# Altium schematic sheet PCB-PWR_01_INPUT_PROTECTION.SchDoc
size 420 x 297 mm
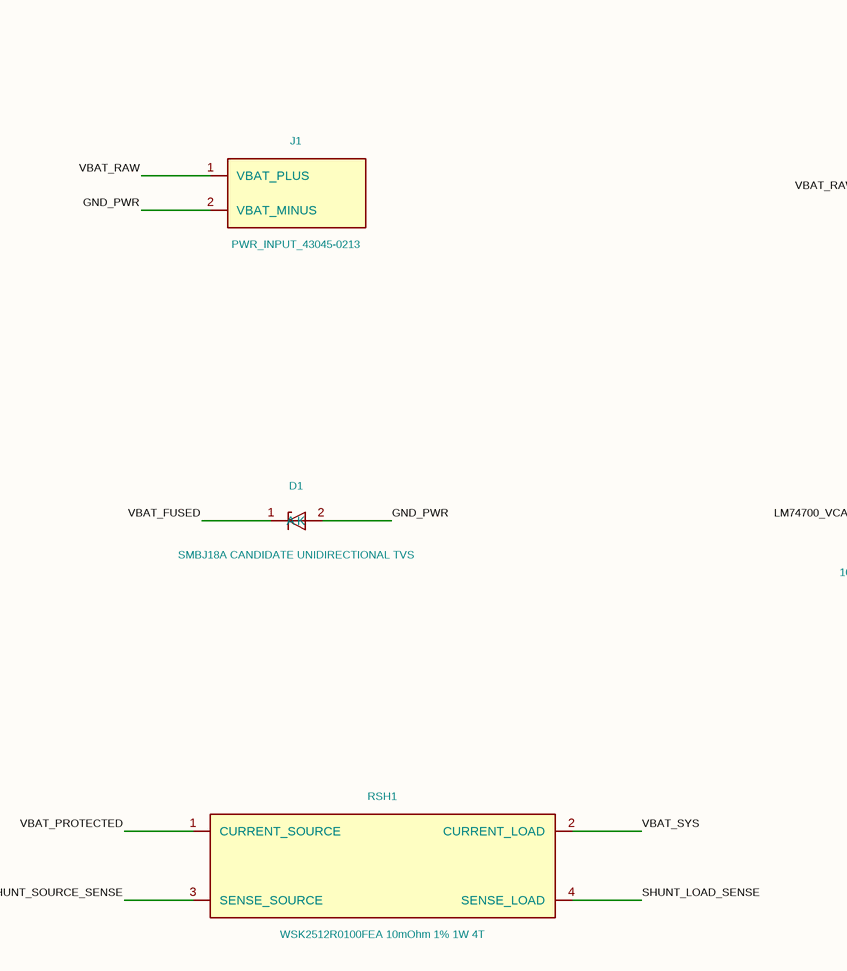
[diagram p0: PCB-PWR_01_INPUT_PROTECTION.SchDoc, top left]
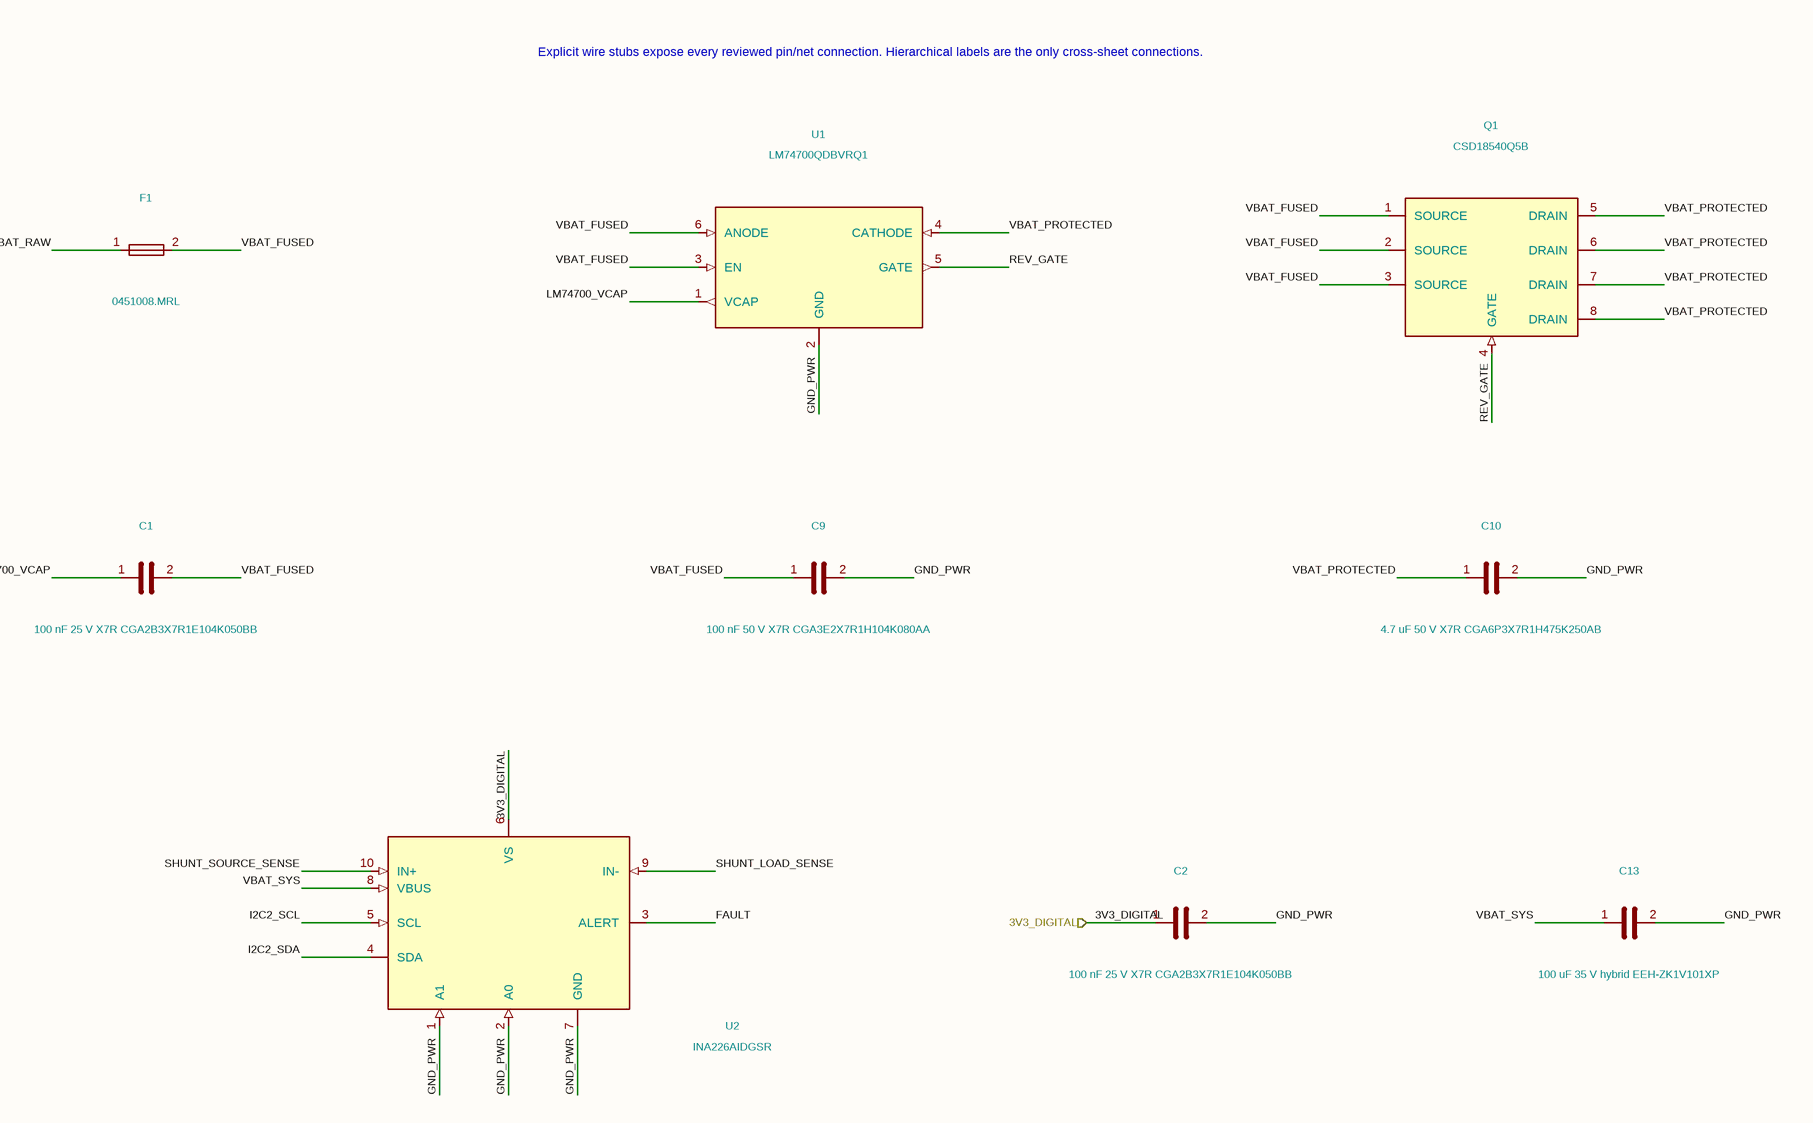
[diagram p1: PCB-PWR_01_INPUT_PROTECTION.SchDoc, top right]
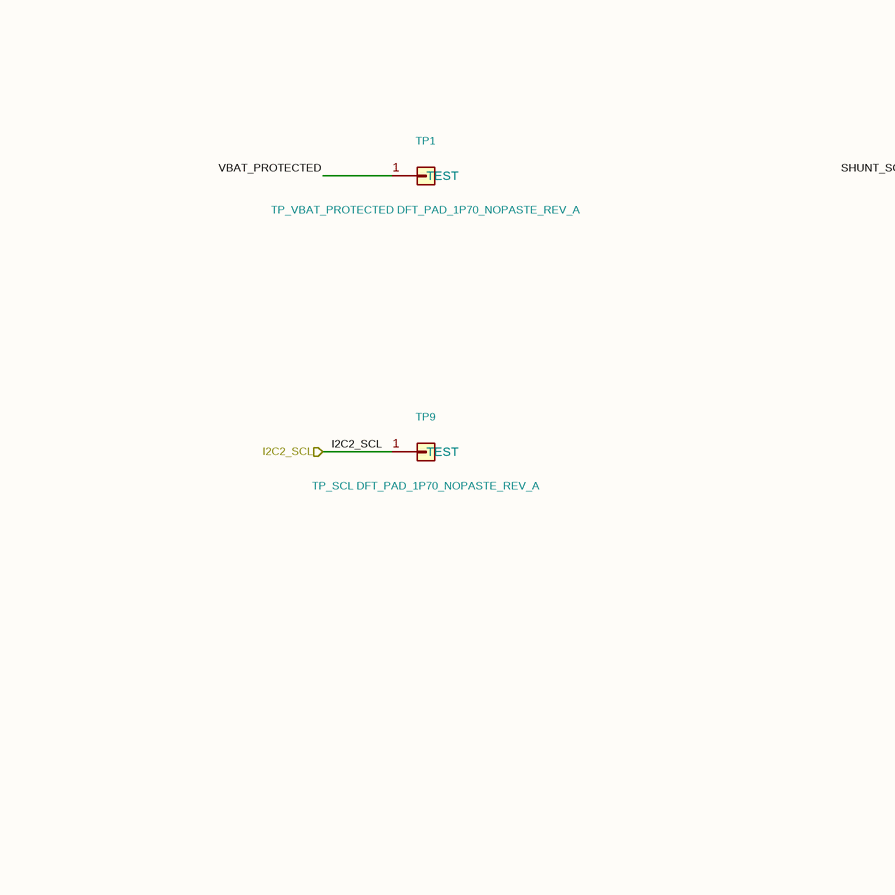
[diagram p2: PCB-PWR_01_INPUT_PROTECTION.SchDoc, bottom left]
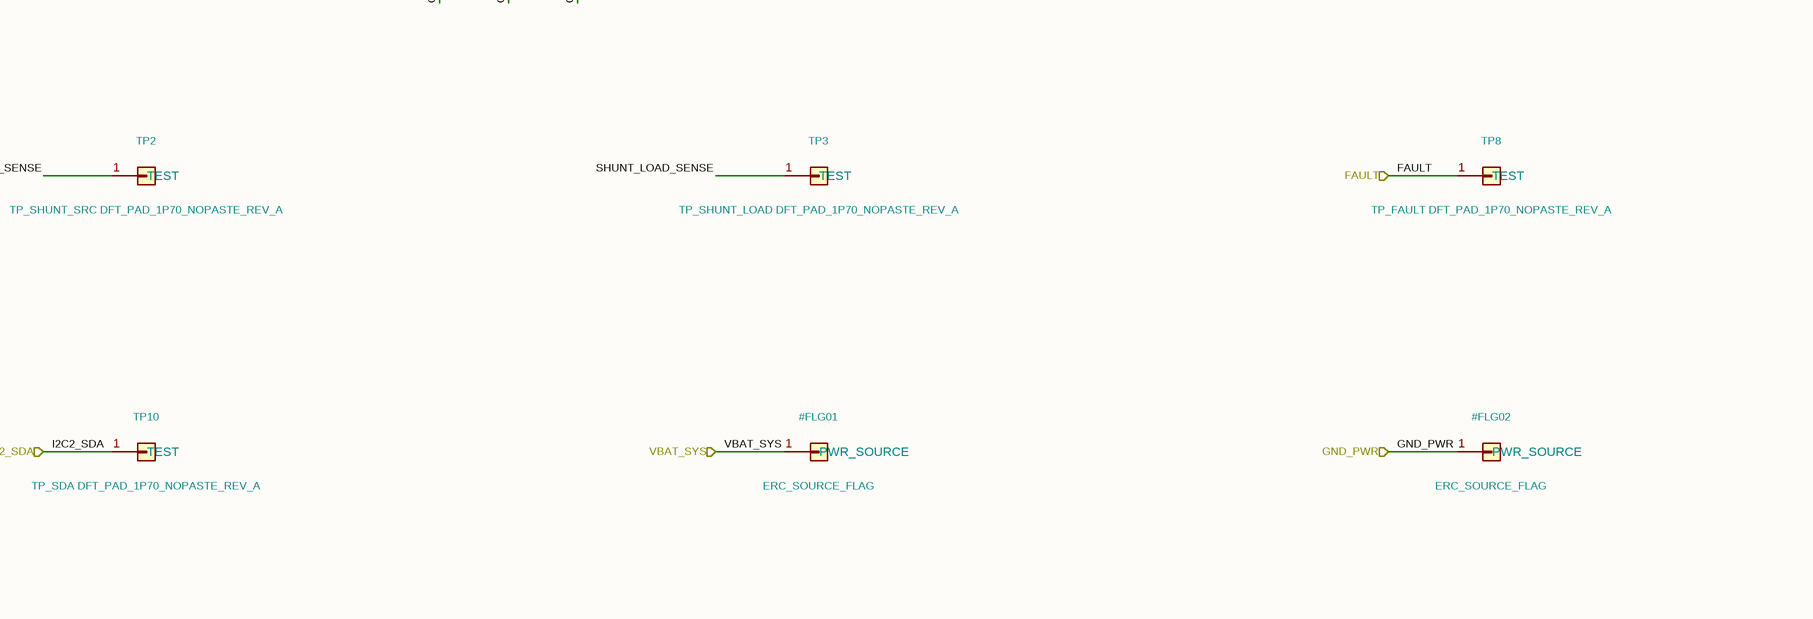
[diagram p3: PCB-PWR_01_INPUT_PROTECTION.SchDoc, bottom right]

## Parts
#FLG01  ERC_SOURCE_FLAG
#FLG02  ERC_SOURCE_FLAG
C1  100 nF 25 V X7R CGA2B3X7R1E104K050BB  [C_0402_1005Metric]
C2  100 nF 25 V X7R CGA2B3X7R1E104K050BB  [C_0402_1005Metric]
C9  100 nF 50 V X7R CGA3E2X7R1H104K080AA  [C_0603_1608Metric]
C10  4.7 uF 50 V X7R CGA6P3X7R1H475K250AB  [C_1210_3225Metric]
C13  100 uF 35 V hybrid EEH-ZK1V101XP  [CP_Elec_6.3x7.7]
D1  SMBJ18A CANDIDATE UNIDIRECTIONAL TVS  [D_SMB]
F1  0451008.MRL  [Fuse_1206_3216Metric]
J1  PWR_INPUT_43045-0213  [Molex_43045-0213_MicroFit-2_Vertical]
Q1  CSD18540Q5B  [CSD18540Q5B_DNK]
RSH1  WSK2512R0100FEA 10mOhm 1% 1W 4T  [Vishay_WSK2512_4T_T1.19mm]
TP1  TP_VBAT_PROTECTED DFT_PAD_1P70_NOPASTE_REV_A  [TestPoint_DFT_1.7mm_NoPaste]
TP2  TP_SHUNT_SRC DFT_PAD_1P70_NOPASTE_REV_A  [TestPoint_DFT_1.7mm_NoPaste]
TP3  TP_SHUNT_LOAD DFT_PAD_1P70_NOPASTE_REV_A  [TestPoint_DFT_1.7mm_NoPaste]
TP8  TP_FAULT DFT_PAD_1P70_NOPASTE_REV_A  [TestPoint_DFT_1.7mm_NoPaste]
TP9  TP_SCL DFT_PAD_1P70_NOPASTE_REV_A  [TestPoint_DFT_1.7mm_NoPaste]
TP10  TP_SDA DFT_PAD_1P70_NOPASTE_REV_A  [TestPoint_DFT_1.7mm_NoPaste]
U1  LM74700QDBVRQ1  [TI_DBV0006A_SOT23-6]
U2  INA226AIDGSR  [TI_DGS0010A_VSSOP10]

## Ports
3V3_DIGITAL, FAULT, GND_PWR, I2C2_SCL, I2C2_SDA, VBAT_SYS

## Nets
3V3_DIGITAL: C2.1 U2.6(VS) ; port 3V3_DIGITAL
FAULT: TP8.1(TEST) U2.3(ALERT) ; port FAULT
GND_PWR: #FLG02.1(PWR_SOURCE) C2.2 C9.2 C10.2 C13.2 D1.2(A) J1.2(VBAT_MINUS) U1.2(GND) U2.1(A1) U2.2(A0) U2.7(GND) ; port GND_PWR
I2C2_SCL: TP9.1(TEST) U2.5(SCL) ; port I2C2_SCL
I2C2_SDA: TP10.1(TEST) U2.4(SDA) ; port I2C2_SDA
LM74700_VCAP: C1.1 U1.1(VCAP)
REV_GATE: Q1.4(GATE) U1.5(GATE)
SHUNT_LOAD_SENSE: RSH1.4(SENSE_LOAD) TP3.1(TEST) U2.9(IN-)
SHUNT_SOURCE_SENSE: RSH1.3(SENSE_SOURCE) TP2.1(TEST) U2.10(IN+)
VBAT_FUSED: C1.2 C9.1 D1.1(K) F1.2 Q1.1(SOURCE) Q1.2(SOURCE) Q1.3(SOURCE) U1.3(EN) U1.6(ANODE)
VBAT_PROTECTED: C10.1 Q1.5(DRAIN) Q1.6(DRAIN) Q1.7(DRAIN) Q1.8(DRAIN) RSH1.1(CURRENT_SOURCE) TP1.1(TEST) U1.4(CATHODE)
VBAT_RAW: F1.1 J1.1(VBAT_PLUS)
VBAT_SYS: #FLG01.1(PWR_SOURCE) C13.1 RSH1.2(CURRENT_LOAD) U2.8(VBUS) ; port VBAT_SYS

## Notes on the sheet
- Explicit wire stubs expose every reviewed pin/net connection. Hierarchical labels are the only cross-sheet connections.
- 1
- 2
- 3
- 4
- 5
- 6
- 7
- 8
- A
- B
- C
- D
- E
- Human-readable hierarchy; exact pin/net equivalence enforced
- Functional sheet 2 of 5
- NOT FOR MANUFACTURE - routing/DRC/DFM/Review B pending
- Title: Input protection + monitor
- File: PCB-PWR_01_INPUT_PROTECTION.kicad_sch
- Sheet: /
- Dioneya / ZS-BPLA
- F
- KiCad E.D.A.  kicad (5.1.4)-1
- Size: A3
- Date: 2026-09-17
- Rev: A
- Id: 1/1

## Library data of the parts
C1 C2 C9 C10 C13 = C
  C1 C2: Value: 100 nF 25 V X7R CGA2B3X7R1E104K050BB; Footprint: Capacitor_SMD:C_0402_1005Metric
  C9: Value: 100 nF 50 V X7R CGA3E2X7R1H104K080AA; Footprint: Capacitor_SMD:C_0603_1608Metric
  C10: Value: 4.7 uF 50 V X7R CGA6P3X7R1H475K250AB; Footprint: Capacitor_SMD:C_1210_3225Metric
  C13: Value: 100 uF 35 V hybrid EEH-ZK1V101XP; Footprint: Capacitor_SMD:CP_Elec_6.3x7.7
D1 = D_Zener: Value: SMBJ18A CANDIDATE UNIDIRECTIONAL TVS; Footprint: Diode_SMD:D_SMB
F1 = Fuse: Value: 0451008.MRL; Footprint: Fuse:Fuse_1206_3216Metric
J1 = Conn_01x02: Value: PWR_INPUT_43045-0213; Footprint: DioneyaPWR:Molex_43045-0213_MicroFit-2_Vertical
Q1 = Conn_01x08: Value: CSD18540Q5B; Footprint: DioneyaPWR:CSD18540Q5B_DNK
RSH1 = Conn_01x04: Value: WSK2512R0100FEA 10mOhm 1% 1W 4T; Footprint: DioneyaPWR:Vishay_WSK2512_4T_T1.19mm
TP1-TP3 TP8-TP10 = TESTPOINT: Footprint: DioneyaPWR:TestPoint_DFT_1.7mm_NoPaste
  TP1: Value: TP_VBAT_PROTECTED DFT_PAD_1P70_NOPASTE_REV_A
  TP2: Value: TP_SHUNT_SRC DFT_PAD_1P70_NOPASTE_REV_A
  TP3: Value: TP_SHUNT_LOAD DFT_PAD_1P70_NOPASTE_REV_A
  TP8: Value: TP_FAULT DFT_PAD_1P70_NOPASTE_REV_A
  TP9: Value: TP_SCL DFT_PAD_1P70_NOPASTE_REV_A
  TP10: Value: TP_SDA DFT_PAD_1P70_NOPASTE_REV_A
U1 = Conn_01x06: Value: LM74700QDBVRQ1; Footprint: DioneyaPWR:TI_DBV0006A_SOT23-6
U2 = Conn_01x10: Value: INA226AIDGSR; Footprint: DioneyaPWR:TI_DGS0010A_VSSOP10
#FLG01 #FLG02 = ERC_SOURCE_FLAG: Value: ERC_SOURCE_FLAG